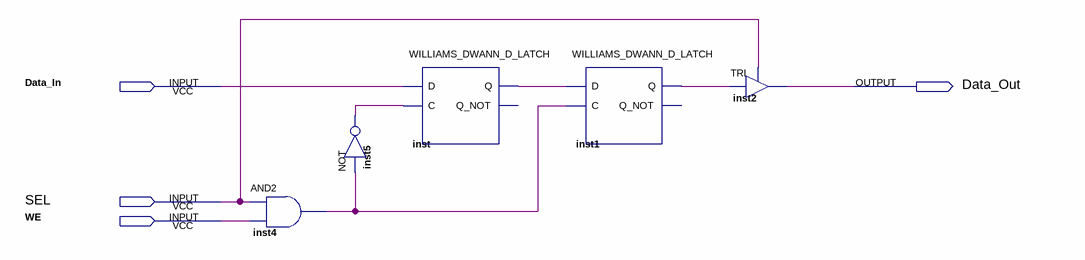
[diagram p0: schematic sheet]
// Quartus schematic WILLIAMS_DWANN_SRAM_CELL.bdf as structural Verilog: 5 symbols, 4 pins
module WILLIAMS_DWANN_SRAM_CELL (
  input  Data_In,
  input  SEL,
  input  WE,
  output Data_Out
);

  wire inst1_q, inst4_out, inst5_out, inst_q;

  and inst4 (inst4_out, SEL, WE);
  not inst5 (inst5_out, inst4_out);
  WILLIAMS_DWANN_D_LATCH inst (.D(Data_In), .C(inst5_out), .Q(inst_q));  // open: Q_NOT
  WILLIAMS_DWANN_D_LATCH inst1 (.D(inst_q), .C(inst4_out), .Q(inst1_q));  // open: Q_NOT
  TRI inst2 (.IN(inst1_q), .OE(SEL), .OUT(Data_Out));
endmodule
